# EasyEDA Pro project 物联网底板.eprj, schematic 物联网底板
Board Name: PCB4; Create Date: 2026-09-08; Page Name: P1; Project Name: 物联网底板; Schematic Name: 物联网底板; Update Date: 2026-09-11; Company: 嘉立创EDA; Page Size: A4; Version: V1.0
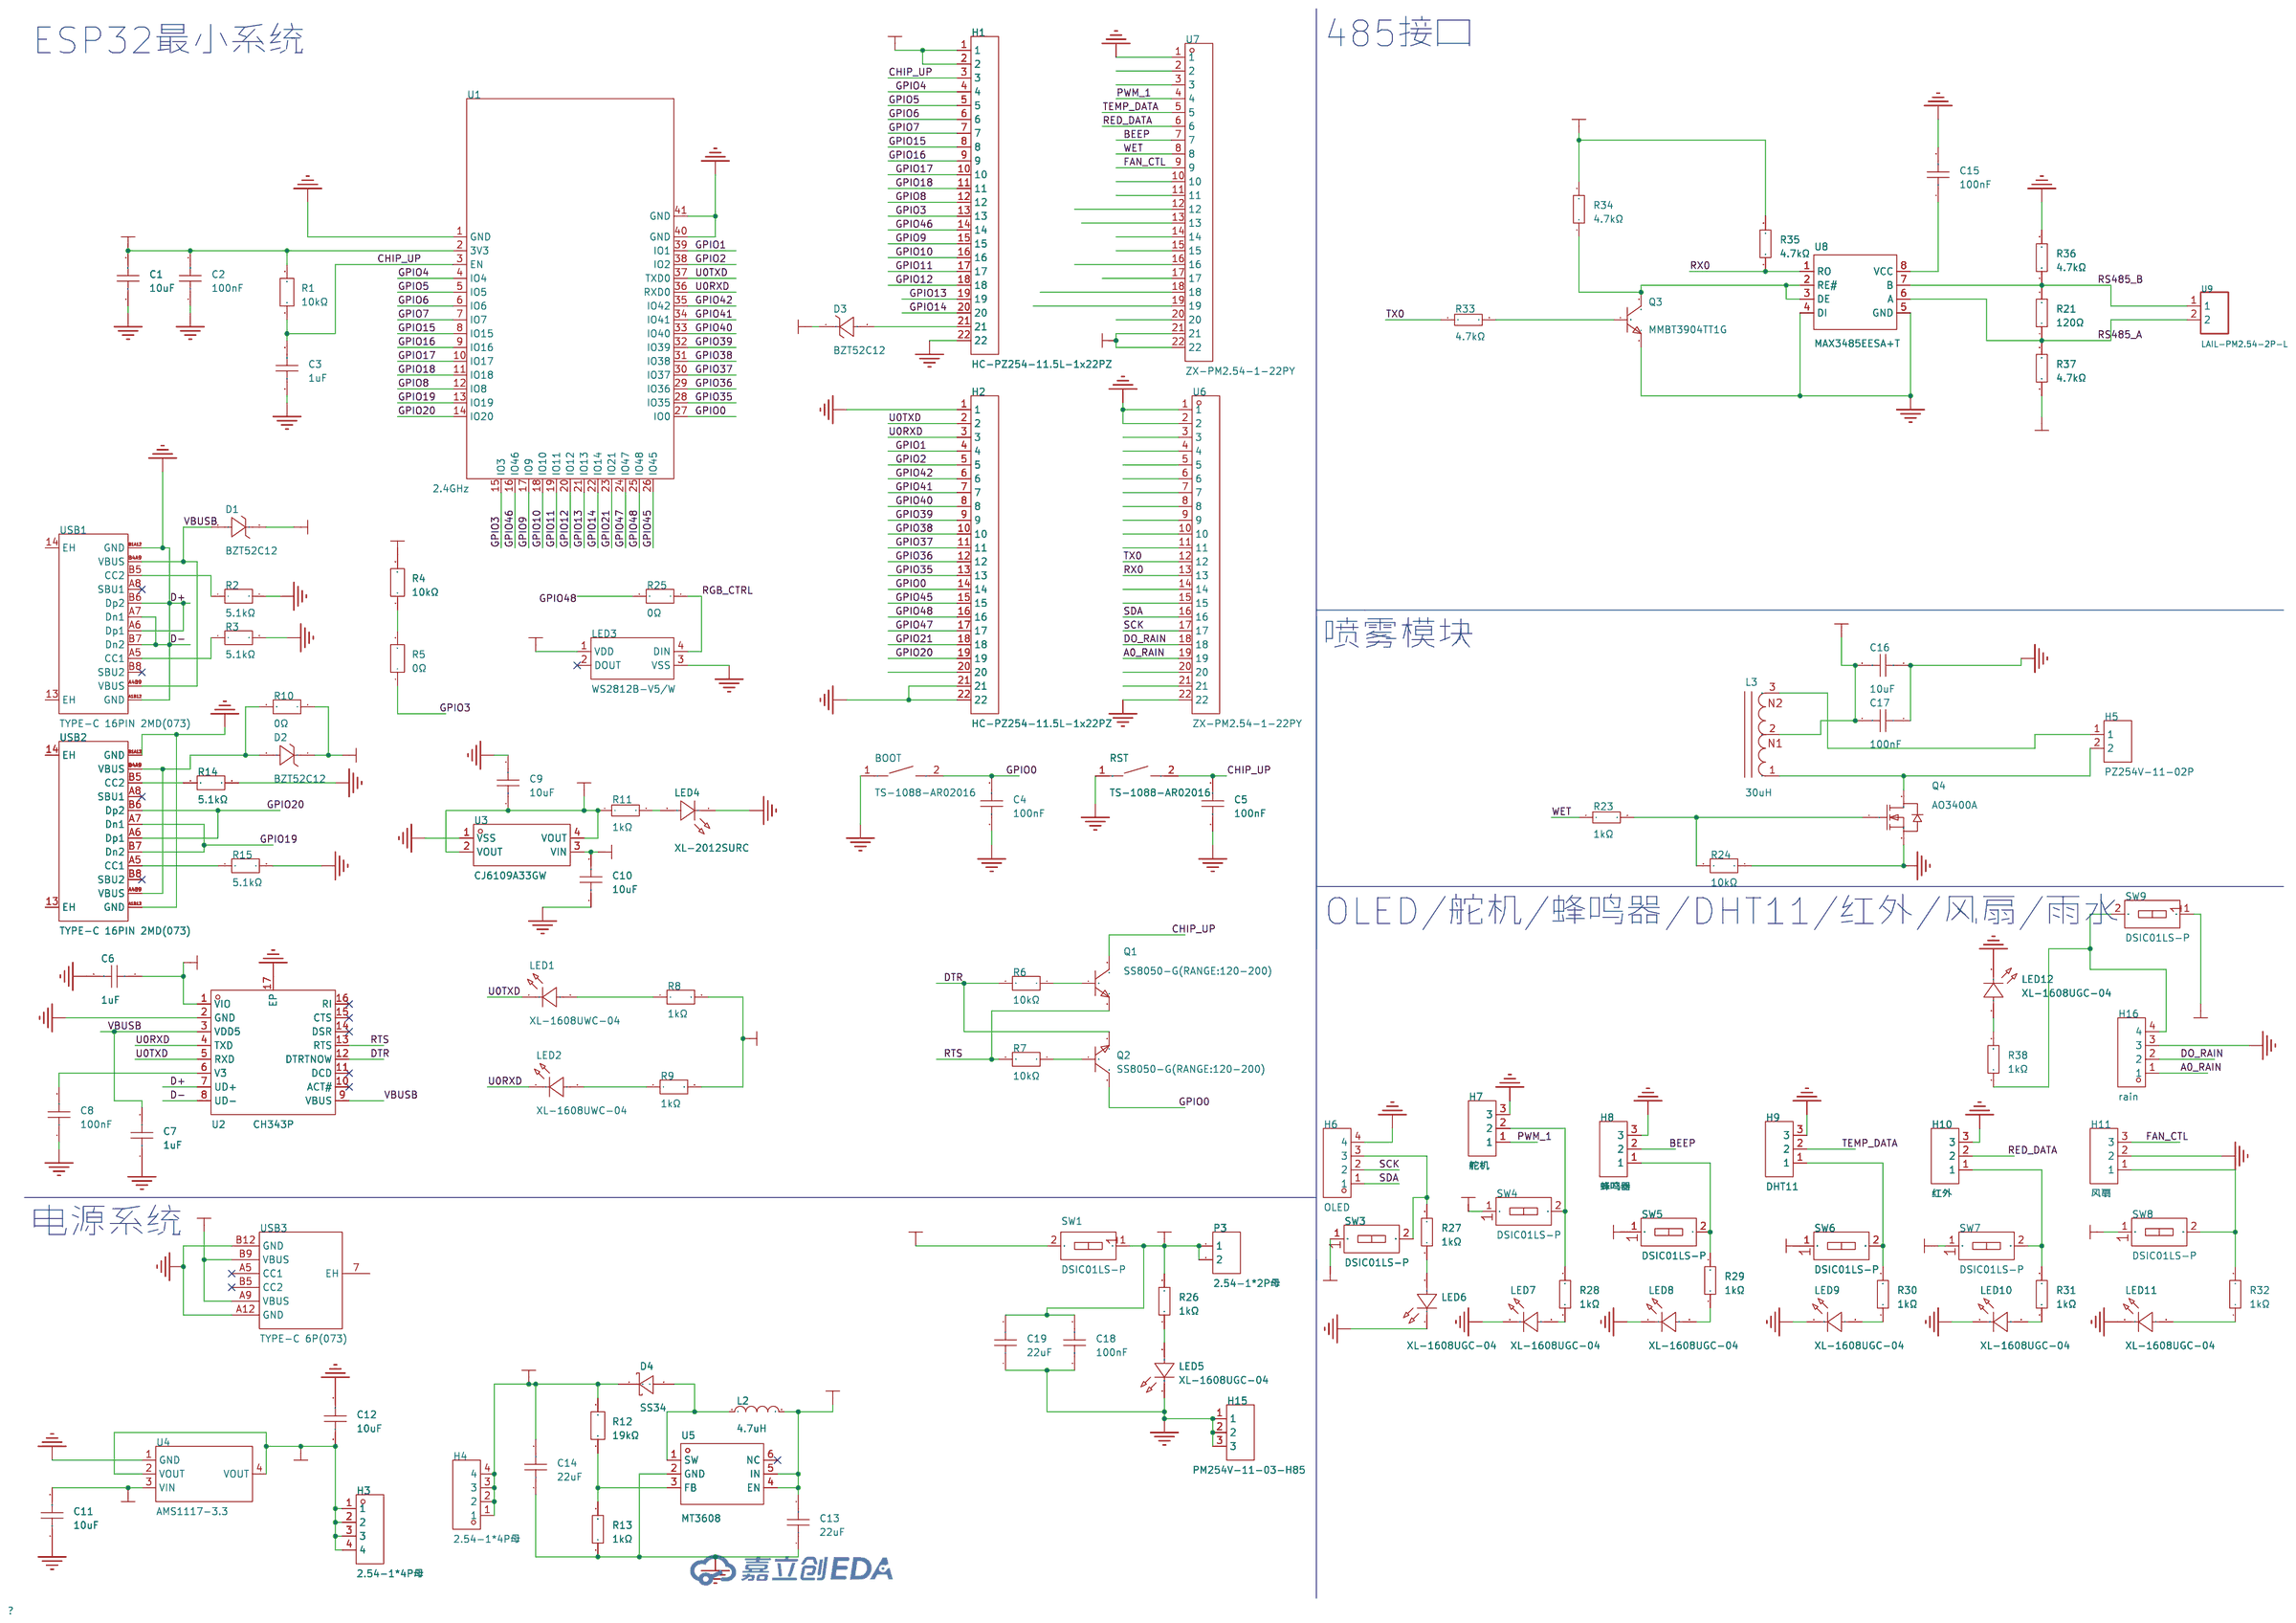
[diagram p1: schematic sheet]

## Parts
BOOT  TS-1088-AR02016  [SW-SMD_L3.9-W3.0-P4.45]
C1  10uF  [C0402]
C2  100nF  [C0402]
C3  1uF  [C0402]
C4  100nF  [C0402]
C5  100nF  [C0402]
C6  1uF  [C0402]
C7  1uF  [C0402]
C8  100nF  [C0402]
C9  10uF  [C0402]
C10  10uF  [C0402]
C11  10uF  [C0402]
C12  10uF  [C0402]
C13  22uF  [C0603]
C14  22uF  [C0603]
C15  100nF  [C0603]
C16  10uF  [C0402]
C17  100nF  [C0402]
C18  100nF  [C0603]
C19  22uF  [C0603]
D1  BZT52C12  [SOD-123_L2.7-W1.6-LS3.7-RD]
D2  BZT52C12  [SOD-123_L2.7-W1.6-LS3.7-RD]
D3  BZT52C12  [SOD-123_L2.7-W1.6-LS3.7-RD]
D4  SS34  [SMA_L4.3-W2.6-LS5.2-RD]
H1  HC-PZ254-11.5L-1x22PZ  [HDR-TH_22P-P2.54-V-M]
H2  HC-PZ254-11.5L-1x22PZ  [HDR-TH_22P-P2.54-V-M]
H3  2.54-1*4P母  [HDR-TH_4P-P2.54-V-F]
H4  2.54-1*4P母  [HDR-TH_4P-P2.54-V-F]
H5  PZ254V-11-02P  [HDR-TH_2P-P2.54-V-M]
H6  OLED  [HDR-TH_4P-P2.54-V-F]
H7  舵机  [HDR-TH_3P-P2.54-V-M_PZ254V-11-03P]
H8  蜂鸣器  [HDR-TH_3P-P2.54-V-F]
H9  DHT11  [HDR-TH_3P-P2.54-V-F]
H10  红外  [HDR-TH_3P-P2.54-V-F]
H11  风扇  [HDR-TH_3P-P2.54-V-F]
H15  PM254V-11-03-H85  [HDR-TH_3P-P2.54-V-F]
H16  rain  [HDR-TH_4P-P2.54-V-F]
L2  4.7uH  [IND-SMD_L2.5-W2.0-VLS252012CX-150M]
L3  30uH  [IND-TH_3P-BD9.5_XR8X10-300K-152K-L]
LED1  XL-1608UWC-04  [LED0603-RD_WHITE]
LED2  XL-1608UWC-04  [LED0603-RD_WHITE]
LED3  WS2812B-V5/W  [LED-SMD_4P-L5.0-W5.0-TL-1]
LED4  XL-2012SURC  [LED0805-RD_RED]
LED5  XL-1608UGC-04  [LED0603-RD_GREEN]
LED6  XL-1608UGC-04  [LED0603-RD_GREEN]
LED7  XL-1608UGC-04  [LED0603-RD_GREEN]
LED8  XL-1608UGC-04  [LED0603-RD_GREEN]
LED9  XL-1608UGC-04  [LED0603-RD_GREEN]
LED10  XL-1608UGC-04  [LED0603-RD_GREEN]
LED11  XL-1608UGC-04  [LED0603-RD_GREEN]
LED12  XL-1608UGC-04  [LED0603-RD_GREEN]
P3  2.54-1*2P母  [HDR-TH_2P-P2.54-V-F]
Q1  SS8050-G(RANGE:120-200)  [SOT-23-3_L2.9-W1.3-P1.90-LS2.4-BR]
Q2  SS8050-G(RANGE:120-200)  [SOT-23-3_L2.9-W1.3-P1.90-LS2.4-BR]
Q3  MMBT3904TT1G  [SC-75-3_L1.6-W0.8-P1.00-LS1.6-BR]
Q4  AO3400A  [SOT-23-3_L2.9-W1.3-P1.90-LS2.4-BR]
R1  10kΩ  [R0402]
R2  5.1kΩ  [R0402]
R3  5.1kΩ  [R0402]
R4  10kΩ  [R0402]
R5  0Ω  [R0603]
R6  10kΩ  [R0402]
R7  10kΩ  [R0402]
R8  1kΩ  [R0402]
R9  1kΩ  [R0402]
R10  0Ω  [R0603]
R11  1kΩ  [R0402]
R12  19kΩ  [R0805]
R13  1kΩ  [R0603]
R14  5.1kΩ  [R0402]
R15  5.1kΩ  [R0402]
R21  120Ω  [R0805]
R23  1kΩ  [R0603]
R24  10kΩ  [R0402]
R25  0Ω  [R0603]
R26  1kΩ  [R0603]
R27  1kΩ  [R0603]
R28  1kΩ  [R0603]
R29  1kΩ  [R0603]
R30  1kΩ  [R0603]
R31  1kΩ  [R0603]
R32  1kΩ  [R0603]
R33  4.7kΩ  [R0603]
R34  4.7kΩ  [R0603]
R35  4.7kΩ  [R0603]
R36  4.7kΩ  [R0603]
R37  4.7kΩ  [R0603]
R38  1kΩ  [R0603]
RST  TS-1088-AR02016  [SW-SMD_L3.9-W3.0-P4.45]
SW1  DSIC01LS-P  [SW-SMD_2P-L3.5-W6.1-P2.54-LS9.8]
SW3  DSIC01LS-P  [SW-SMD_2P-L3.5-W6.1-P2.54-LS9.8]
SW4  DSIC01LS-P  [SW-SMD_2P-L3.5-W6.1-P2.54-LS9.8]
SW5  DSIC01LS-P  [SW-SMD_2P-L3.5-W6.1-P2.54-LS9.8]
SW6  DSIC01LS-P  [SW-SMD_2P-L3.5-W6.1-P2.54-LS9.8]
SW7  DSIC01LS-P  [SW-SMD_2P-L3.5-W6.1-P2.54-LS9.8]
SW8  DSIC01LS-P  [SW-SMD_2P-L3.5-W6.1-P2.54-LS9.8]
SW9  DSIC01LS-P  [SW-SMD_2P-L3.5-W6.1-P2.54-LS9.8]
U1  2.4GHz  [WIRELM-SMD_ESP32-S3-WROOM-1]
U2  CH343P  [TQFN-16_L3.0-W3.0-P0.50-BL-EP1.7]
U3  CJ6109A33GW  [SOT-223-3_L6.5-W3.4-P2.30-LS7.0-BR]
U4  AMS1117-3.3  [SOT-223-3_L6.5-W3.4-P2.30-LS7.0-BR]
U5  MT3608  [SOT-23-6_L2.9-W1.6-P0.95-LS2.8-BL]
U6  ZX-PM2.54-1-22PY  [HDR-TH_22P-P2.54-V-F]
U7  ZX-PM2.54-1-22PY  [HDR-TH_22P-P2.54-V-F]
U8  MAX3485EESA+T  [SOIC-8_L4.9-W3.9-P1.27-LS6.0-BL]
U9  LAIL-PM2.54-2P-L  [HDR-TH_2P-P2.54-V-F]
USB1  TYPE-C 16PIN 2MD(073)  [USB-C-SMD_TYPE-C-16PIN-2MD-073]
USB2  TYPE-C 16PIN 2MD(073)  [USB-C-SMD_TYPE-C-16PIN-2MD-073]
USB3  TYPE-C 6P(073)  [TYPE-C-SMD_TYPE-C-6P-073]

## Library data of the parts
BOOT RST = TS-1088-AR02016: LCSC Part Name: 3.9*3*2mm 立贴 轻触开关; Supplier Part: C720477; Manufacturer: XUNPU(讯普); Supplier Footprint: SMD,4x3mm; JLCPCB Part Class: 基础库; Datasheet: https://item.szlcsc.com/datasheet/TS-1088-AR02016/763484.html; Supplier: LCSC; Circuit: 单刀单掷; Actuator Style: 圆形按钮; Operating Force: 1.6N; Mounting Type: 立贴; Length: 3.9mm; Width: 3mm; Switch Height: 2mm; with Bracket: 不带支架; Contact Current: 50mA; Voltage Rating: 12V; Actuator/Cap Color: 黑色; Termination Style: SMD接片; Life: 10万次; Operating Temperature: -30℃~+80℃
C1 C9-C12 C16 = HGC0402R5106M100NTEJ: LCSC Part Name: 10uF ±20% 10V; Supplier Part: C7472949; Manufacturer: Chinocera(华瓷); Supplier Footprint: 0402; JLCPCB Part Class: 扩展库; Datasheet: https://item.szlcsc.com/datasheet/HGC0402R5106M100NTEJ/8532796.html; Supplier: LCSC; Tolerance: ±20%; Voltage Rating: 10V; Temperature Coefficient: X5R
C2 C4 C5 C8 C17 = CL05B104KO5NNNC: LCSC Part Name: 100nF ±10% 16V; Supplier Part: C1525; Manufacturer: SAMSUNG(三星); Supplier Footprint: 0402; JLCPCB Part Class: 基础库; Datasheet: https://item.szlcsc.com/datasheet/CL05B104KO5NNNC/1877.html; Supplier: LCSC; Tolerance: ±10%; Voltage Rating: 16V; Temperature Coefficient: X7R
C3 C6 C7 = HGC0402R5105K500NTEJ: LCSC Part Name: 1uF ±10% 50V; Supplier Part: C7472948; Manufacturer: Chinocera(华瓷); Supplier Footprint: 0402; JLCPCB Part Class: 扩展库; Datasheet: https://item.szlcsc.com/datasheet/HGC0402R5105K500NTEJ/8532795.html; Supplier: LCSC; Tolerance: ±10%; Voltage Rating: 50V; Temperature Coefficient: X5R
C13 C14 C19 = CL10A226MQ8NRNC: LCSC Part Name: 22uF ±20% 6.3V; Supplier Part: C59461; Manufacturer: SAMSUNG(三星); Supplier Footprint: 0603; JLCPCB Part Class: 基础库; Datasheet: https://item.szlcsc.com/datasheet/CL10A226MQ8NRNC/60514.html; Supplier: LCSC; Tolerance: ±20%; Voltage Rating: 6.3V; Temperature Coefficient: X5R
C15 C18 = CC0603KRX7R9BB104: LCSC Part Name: 100nF ±10% 50V; Supplier Part: C14663; Manufacturer: YAGEO(国巨); Supplier Footprint: 0603; JLCPCB Part Class: 基础库; Datasheet: https://item.szlcsc.com/datasheet/CC0603KRX7R9BB104/15331.html; Supplier: LCSC; Tolerance: ±10%; Voltage Rating: 50V; Temperature Coefficient: X7R
D1-D3 = BZT52C12_C19077410: LCSC Part Name: 表面贴装齐纳二极管; Supplier Part: C19077410; Manufacturer: R+O(宏嘉诚); Supplier Footprint: SOD-123; JLCPCB Part Class: 扩展库; Datasheet: https://item.szlcsc.com/datasheet/BZT52C12/20275495.html; Supplier: LCSC; Diode Configuration: 1个独立式; Zener Voltage(Nom): 12V; Reverse Leakage Current (Ir): 100nA@8V; Zener Voltage(Range): 11.4V~12.6V; Pd - Power Dissipation: 350mW; Impedance(Zzt): 25Ω; Impedance(Zzk): 150Ω; Operating Junction Temperature Range: -55℃~+150℃
D4 = SS34_C8678: LCSC Part Name: 电压:40V 电流:3A; Supplier Part: C8678; Manufacturer: MDD(辰达半导体); Supplier Footprint: SMA(DO-214AC); JLCPCB Part Class: 基础库; Datasheet: https://item.szlcsc.com/datasheet/SS34/9178.html; Supplier: LCSC; Diode Configuration: 独立式; Voltage - Forward(Vf@If): 550mV@3A; Voltage - DC Reverse(Vr): 40V; Current - Rectified: 3A; Reverse Leakage Current (Ir): 500uA@40V; Operating Junction Temperature Range: -55℃~+125℃
H1 H2 = HC-PZ254-11.5L-1x22PZ: LCSC Part Name: 1x22P 间距:2.54mm 方针 直插; Supplier Part: C41375941; Manufacturer: HC(虹成电子); Supplier Footprint: 插件,P=2.54mm; JLCPCB Part Class: 扩展库; Datasheet: https://item.szlcsc.com/datasheet/HC-PZ254-11.5L-1x22PZ/43143790.html; Supplier: LCSC; Pin Structure: 1x22P; Pitch: 2.54mm; Circluar Pins/Square Pins: 方针; Mounting Type: 直插; Number of Rows: 单排; Number of Pins: 22P; Current Rating: 3A; Length of Mating Pin: 6mm; Insulation Height: 2.5mm; Length of End Connection Pin: 3mm; Contact Material: 黄铜; Contact Plating: 金; Operating Temperature: -40℃~+105℃; Color: 黑色
H3 H4 H6 H16 = 2.54-1*4P母: LCSC Part Name: 间距:2.54mm 1x4P 直插; Supplier Part: C2718488; Manufacturer: BOOMELE(博穆精密); Supplier Footprint: 插件,P=2.54mm; JLCPCB Part Class: 扩展库; Datasheet: https://item.szlcsc.com/datasheet/2.54-1*4P%25E6%25AF%258D/2834502.html; Supplier: LCSC; Holes Structure: 1x4P; Pitch: 2.54mm; Circular Hole / Square Hole: 方孔; Mounting Type: 直插; Number of Rows: 单排; Number of Positions: 4P; Current Rating: 3A; Holes Direction: 顶部; Contact Material: 青铜; Operating Temperature: -40℃~+105℃
H5 = PZ254V-11-02P: LCSC Part Name: 1x2P 间距:2.54mm 方针 直插; Supplier Part: C492401; Manufacturer: XFCN(兴飞); Supplier Footprint: 插件,P=2.54mm; JLCPCB Part Class: 扩展库; Datasheet: https://item.szlcsc.com/datasheet/PZ254V-11-02P/502957.html; Supplier: LCSC; Pin Structure: 1x2P; Pitch: 2.54mm; Circluar Pins/Square Pins: 方针; Mounting Type: 直插; Number of Rows: 单排; Number of Pins: 2P; Current Rating: 3A; Voltage Rating (Max): 250V; Length of Mating Pin: 6.1mm; Insulation Height: 2.5mm; Length of End Connection Pin: 3mm; Contact Material: 黄铜; Contact Plating: 金; Operating Temperature: -40℃~+105℃; Color: 黑色
H7 = PZ254V-11-03P: LCSC Part Name: 1x3P 间距:2.54mm 方针 直插; Supplier Part: C2937625; Manufacturer: XFCN(兴飞); Supplier Footprint: 插件,P=2.54mm; JLCPCB Part Class: Extended Part; Datasheet: https://item.szlcsc.com/datasheet/PZ254V-11-03P/3293280.html; Supplier: LCSC; Pin Structure: 1x3P; Pitch: 2.54mm; Circluar Pins/Square Pins: 方针; Mounting Type: 直插; Number of Rows: 单排; Number of Pins: 3P; Current Rating: 3A; Voltage Rating (Max): 250V; Length of Mating Pin: 6.1mm; Insulation Height: 2.5mm; Length of End Connection Pin: 3mm; Contact Material: 黄铜; Contact Plating: 金; Operating Temperature: -40℃~+105℃; Color: 黑色
H8-H11 H15 = PM254V-11-03-H85: LCSC Part Name: 1x3P 间距:2.54mm 直插; Supplier Part: C541850; Manufacturer: XFCN(兴飞); Supplier Footprint: 插件,P=2.54mm; JLCPCB Part Class: 扩展库; Datasheet: https://item.szlcsc.com/datasheet/PM254V-11-03-H85/562471.html; Supplier: LCSC; Holes Structure: 1x3P; Pitch: 2.54mm; Circular Hole / Square Hole: 方孔; Mounting Type: 直插; Number of Rows: 单排; Number of Positions: 3P; Current Rating: 3A; Holes Direction: 顶部; Insulation Height: 8.5mm; Contact Material: 黄铜; Operating Temperature: -40℃~+105℃
L2 = FTC252010S4R7MBCA: LCSC Part Name: 4.7uH ±20% 2.6A; Supplier Part: C5832360; Manufacturer: cjiang(长江微电); Supplier Footprint: 1008; JLCPCB Part Class: 扩展库; Datasheet: https://item.szlcsc.com/datasheet/FTC252010S4R7MBCA/6763480.html; Supplier: LCSC; Tolerance: ±20%; Current Rating: 2A; Current - Saturation(Isat): 2.6A; DC Resistance(DCR): 160mΩ
L3 = XR8*10-300K-152K-L: LCSC Part Name: XR8*10 30uH:1.5mH 0.19线 三脚电感; Supplier Part: C48947010; Manufacturer: XR(祥如); Supplier Footprint: 插件,D9.5xL14mm; JLCPCB Part Class: 扩展库; Datasheet: https://item.szlcsc.com/datasheet/XR8*10-300K-152K-L/51267337.html; Supplier: LCSC; Tolerance: ±15%; DC Resistance(DCR): 5Ω; Type: 工字电感; Wire Diameter: 0.19mm
LED1 LED2 = XL-1608UWC-04: LCSC Part Name: 0603白光贴片式发光二极管; Supplier Part: C965808; Manufacturer: XINGLIGHT(成兴光); Supplier Footprint: 0603; JLCPCB Part Class: 扩展库; Datasheet: https://item.szlcsc.com/datasheet/XL-1608UWC-04/1051417.html; Supplier: LCSC; Lamp Holder Type: 1.6mmx0.8mm方形灯头; Illumination Color: 白色; Voltage - Forward(Vf): 2.7V; Power(Watts): 70mW; Test Current: 20mA; Diode Configuration: 独立二极管; Lens Color: 黄色透镜; Color Temperature: 10000K~33000K; Luminous Intensity: 630mcd; Viewing Angle: 120°; Mounting Style: 正贴; Operating Temperature: -40℃~+85℃; ESD Withstand Voltage: 2000V
LED3 = WS2812B-V5/W: LCSC Part Name: RGB三色; Supplier Part: C2874885; Manufacturer: worldsemi; Supplier Footprint: SMD5050-4P; JLCPCB Part Class: 扩展库; Datasheet: https://item.szlcsc.com/datasheet/WS2812B-V5%252FW/3081328.html; Supplier: LCSC; Dominant Wavelength - R: 620nm~630nm; Dominant Wavelength - G: 515nm~525nm; Dominant Wavelength - B: 465nm~475nm; Data Transmission Rate: 800Kbit/s; Voltage - Supply: 5V; Quiescent Current: 0.6mA; Lens Color: 白色雾状透镜; Operating Temperature: -40℃~+65℃; Fixed-Frequency Pwm Mode: 2kHz; Length: 5mm; Width: 1.57mm; Height: 5.4mm; Features: 内置上电复位电路；集成智能反向连接保护功能；内置掉电复位电路; Luminous Intensity - R: 310mcd; Luminous Intensity - G: 780mcd; Luminous Intensity - B: 215mcd; Transmission Delay: 300ns; Fall Time: 120us
LED4 = XL-2012SURC: LCSC Part Name: 0805红贴片式发光二极管; Supplier Part: C965812; Manufacturer: XINGLIGHT(成兴光); Supplier Footprint: 0805; JLCPCB Part Class: Extended Part; Datasheet: https://item.szlcsc.com/datasheet/XL-2012SURC/1051421.html; Supplier: LCSC; Lamp Holder Type: 2mmx1.2mm方形灯头; Illumination Color: 红色; Voltage - Forward(Vf): 2.3V; Power(Watts): 50mW; Forward Current: 20mA; Wavelength - Dominant: 615nm~630nm; Peak Wavelength: 620nm; Diode Configuration: 独立二极管; Lens Color: 无色透明透镜; Luminous Intensity: 230mcd; Viewing Angle: 120°; Mounting Style: 正贴; Operating Temperature: -40℃~+85℃
LED5-LED12 = XL-1608UGC-04: LCSC Part Name: 0603翠绿贴片式发光二极管; Supplier Part: C965804; Manufacturer: XINGLIGHT(成兴光); Supplier Footprint: 0603; JLCPCB Part Class: 扩展库; Datasheet: https://item.szlcsc.com/datasheet/XL-1608UGC-04/1051413.html; Supplier: LCSC; Lamp Holder Type: 1.6mmx0.8mm方形灯头; Illumination Color: 翠绿色; Voltage - Forward(Vf): 3.3V; Power(Watts): 70mW; Forward Current: 20mA; Wavelength - Dominant: 515nm~535nm; Peak Wavelength: 525nm; Diode Configuration: 独立二极管; Lens Color: 无色透明透镜; Luminous Intensity: 810mcd; Viewing Angle: 120°; Mounting Style: 正贴; Operating Temperature: -40℃~+85℃
P3 = 2.54-1*2P母: LCSC Part Name: 1x2P 间距:2.54mm 直插; Supplier Part: C49661; Manufacturer: BOOMELE(博穆精密); Supplier Footprint: 插件,P=2.54mm; JLCPCB Part Class: 扩展库; Datasheet: https://item.szlcsc.com/datasheet/2.54-1*2P%25E6%25AF%258D/50669.html; Supplier: LCSC; Holes Structure: 1x2P; Pitch: 2.54mm; Circular Hole / Square Hole: 方孔; Mounting Type: 直插; Number of Rows: 单排; Number of Positions: 2P; Current Rating: 3A; Holes Direction: 顶部; Contact Material: 黄铜; Operating Temperature: -40℃~+105℃; PIN Length: 3.3mm
Q1 Q2 = SS8050-G(RANGE:120-200): LCSC Part Name: L档(120-200) NPN 电流:1.5A 电压:25V; Supplier Part: C164886; Manufacturer: CJ(江苏长电/长晶); Supplier Footprint: SOT-23; JLCPCB Part Class: 扩展库; Datasheet: https://item.szlcsc.com/datasheet/SS8050-G(RANGE%253A120-200)/176268.html; Supplier: LCSC; type: NPN; Current - Collector(Ic): 1.5A; Collector - Emitter Voltage VCEO: 25V; Pd - Power Dissipation: 300mW; DC Current Gain: 120; Transition frequency(fT): 100MHz; Current - Collector Cutoff: 100nA; Vce Saturation(VCE(sat)): 500mV; Operating Temperature: -55℃~+150℃; Emitter-Base Voltage(Vebo): 5V; Number: 1个NPN
Q3 = MMBT3904TT1G: LCSC Part Name: NPN 电流:200mA 电压:40V; Supplier Part: C242260; Manufacturer: onsemi(安森美); Supplier Footprint: SOT-416; JLCPCB Part Class: Extended Part; Datasheet: https://item.szlcsc.com/datasheet/MMBT3904TT1G/241201.html; Supplier: LCSC; type: NPN; Current - Collector(Ic): 200mA; Collector - Emitter Voltage VCEO: 40V; Pd - Power Dissipation: 200mW; DC Current Gain: 100@0.1mA,1.0V; Transition frequency(fT): 300MHz; Current - Collector Cutoff: 50nA; Vce Saturation(VCE(sat)): 300mV@10mA,5mA; Operating Temperature: -65℃~+150℃; Emitter-Base Voltage(Vebo): 6V; Number: 1个NPN
Q4 = AO3400A_C20917: LCSC Part Name: N沟道 耐压:30V; Supplier Part: C20917; Manufacturer: AOS; Supplier Footprint: SOT-23; JLCPCB Part Class: 基础库; Datasheet: https://item.szlcsc.com/datasheet/AO3400A/21629.html; Supplier: LCSC; Number: 1个N沟道; Drain to Source Voltage: 30V; Current - Continuous Drain(Id): 5.7A; RDS(on): 48mΩ@2.5V; Pd - Power Dissipation: 1.4W; Gate Threshold Voltage (Vgs(th)): 1.45V; Gate Charge(Qg): 7nC@10V; Input Capacitance(Ciss): 630pF; Reverse Transfer Capacitance (Crss@Vds): 50pF; Operating Temperature: -55℃~+150℃; Type: N沟道; Output Capacitance(Coss): 75pF; Vgs: ±12V
R1 R4 R6 R7 R24 = FRC0402F1002TS: LCSC Part Name: 10kΩ ±1% 62.5mW 厚膜电阻; Supplier Part: C2906861; Manufacturer: FOJAN(富捷); Supplier Footprint: 0402; JLCPCB Part Class: Extended Part; Datasheet: https://item.szlcsc.com/datasheet/FRC0402F1002TS/3180374.html; Supplier: LCSC; Type: 厚膜电阻; Tolerance: ±1%; Power(Watts): 62.5mW; Voltage-Supply(Max): 50V; Temperature Coefficient: ±100ppm/℃; Operating Temperature: -55℃~+155℃
R2 R3 R14 R15 = FRC0402J512 TS: LCSC Part Name: 5.1kΩ ±5% 62.5mW 厚膜电阻; Supplier Part: C2906948; Manufacturer: FOJAN(富捷); Supplier Footprint: 0402; JLCPCB Part Class: 扩展库; Datasheet: https://item.szlcsc.com/datasheet/FRC0402J512%2520TS/3180461.html; Supplier: LCSC; Type: 厚膜电阻; Tolerance: ±5%; Power(Watts): 62.5mW; Voltage-Supply(Max): 50V; Temperature Coefficient: ±100ppm/℃; Operating Temperature: -55℃~+155℃
R5 R10 R25 = FRC0603F0000TS: LCSC Part Name: 0Ω ±1% 100mW 厚膜电阻; Supplier Part: C2906974; Manufacturer: FOJAN(富捷); Supplier Footprint: 0603; JLCPCB Part Class: 扩展库; Supplier: LCSC; Type: 厚膜电阻; Tolerance: ±1%; Power(Watts): 100mW; Voltage-Supply(Max): 75V; Operating Temperature: -55℃~+155℃
R8 R9 = FRC0402J102 TS: LCSC Part Name: 1kΩ ±5% 62.5mW 厚膜电阻; Supplier Part: C2906899; Manufacturer: FOJAN(富捷); Supplier Footprint: 0402; JLCPCB Part Class: 扩展库; Datasheet: https://item.szlcsc.com/datasheet/FRC0402J102%2520TS/3180412.html; Supplier: LCSC; Type: 厚膜电阻; Tolerance: ±5%; Power(Watts): 62.5mW; Voltage-Supply(Max): 50V; Temperature Coefficient: ±100ppm/℃; Operating Temperature: -55℃~+155℃
R11 = 0402WGF1001TCE: LCSC Part Name: 厚膜电阻 1kΩ ±1%; Supplier Part: C11702; Manufacturer: UNI-ROYAL(厚声); Supplier Footprint: 0402; JLCPCB Part Class: 基础库; Datasheet: https://item.szlcsc.com/datasheet/0402WGF1001TCE/12256.html; Supplier: LCSC; Type: 厚膜电阻; Tolerance: ±1%; Power(Watts): 62.5mW; Voltage-Supply(Max): 50V; Temperature Coefficient: ±100ppm/℃; Operating Temperature: -55℃~+155℃
R12 = FRC0805F1902TS: LCSC Part Name: 19kΩ ±1% 125mW 厚膜电阻; Supplier Part: C2930177; Manufacturer: FOJAN(富捷); Supplier Footprint: 0805; JLCPCB Part Class: 扩展库; Supplier: LCSC; Type: 厚膜电阻; Tolerance: ±1%; Power(Watts): 125mW; Voltage-Supply(Max): 150V; Temperature Coefficient: ±100ppm/℃; Operating Temperature: -55℃~+155℃
R13 R23 R26-R32 R38 = 0603WAF1001T5E: LCSC Part Name: 1kΩ ±1% 100mW 厚膜电阻; Supplier Part: C21190; Manufacturer: UNI-ROYAL(厚声); Supplier Footprint: 0603; JLCPCB Part Class: 基础库; Datasheet: https://item.szlcsc.com/datasheet/0603WAF1001T5E/21904.html; Supplier: LCSC; Type: 厚膜电阻; Tolerance: ±1%; Power(Watts): 100mW; Voltage-Supply(Max): 75V; Temperature Coefficient: ±100ppm/℃; Operating Temperature: -55℃~+155℃
R21 = 0805W8F1200T5E: LCSC Part Name: 厚膜电阻 120Ω ±1%; Supplier Part: C17437; Manufacturer: UNI-ROYAL(厚声); Supplier Footprint: 0805; JLCPCB Part Class: 基础库; Datasheet: https://item.szlcsc.com/datasheet/0805W8F1200T5E/18125.html; Supplier: LCSC; Type: 厚膜电阻; Tolerance: ±1%; Power(Watts): 125mW; Voltage-Supply(Max): 150V; Temperature Coefficient: ±100ppm/℃; Operating Temperature: -55℃~+155℃
R33-R37 = 0603WAF4701T5E: LCSC Part Name: 厚膜电阻 4.7kΩ ±1%; Supplier Part: C23162; Manufacturer: UNI-ROYAL(厚声); Supplier Footprint: 0603; JLCPCB Part Class: 基础库; Datasheet: https://item.szlcsc.com/datasheet/0603WAF4701T5E/23889.html; Supplier: LCSC; Type: 厚膜电阻; Tolerance: ±1%; Power(Watts): 100mW; Voltage-Supply(Max): 75V; Temperature Coefficient: ±100ppm/℃; Operating Temperature: -55℃~+155℃
SW1 SW3-SW9 = DSIC01LS-P: LCSC Part Name: 平拨,凸起式 1位拨码开关; Supplier Part: C600988; Manufacturer: XKB Connection(中国星坤); Supplier Footprint: SMD; JLCPCB Part Class: 扩展库; Datasheet: https://item.szlcsc.com/datasheet/DSIC01LS-P/631008.html; Supplier: LCSC; Type: 平拨,凸起式; Circuit: 单刀单掷; Number of Positions: 1位; Termination Style: 鸥翼型; Current Rating: 25mA; Voltage Rating: 24V; Operating Temperature: -20℃~+70℃; Operating Life: 3千次; Color: 黑色
U1 = ESP32-S3-WROOM-1-N16R8: LCSC Part Name: 不带固件 通用型Wi-Fi+低功耗蓝牙MCU模组; Supplier Part: C2913202; Manufacturer: ESPRESSIF(乐鑫); Supplier Footprint: SMD,25.5x18mm; JLCPCB Part Class: 扩展库; Datasheet: https://item.szlcsc.com/datasheet/ESP32-S3-WROOM-1-N16R8/3198300.html; Supplier: LCSC; Utilized IC / Part: ESP32-S3R8; Interface Type: I2C；GPIO；UART；SPI；USB；I2S; Antenna Type: 板载PCB天线; Output Power: 20.5dBm; Voltage - Supply: 3V~3.6V; Receive  Current: 95mA; Send  Current: 355mA; Sensitivity: -103.5dBm; Operating Temperature: -40℃~+65℃
U2 = CH343P: LCSC Part Name: USB转高速串口芯片; Supplier Part: C2846043; Manufacturer: WCH(南京沁恒); Supplier Footprint: TQFN-16-EP(3x3); JLCPCB Part Class: 扩展库; Datasheet: https://item.szlcsc.com/datasheet/CH343P/3039795.html; Supplier: LCSC; Applications Function: USB转UART; USB Protocol: USB 2.0; Voltage - Supply: 3.3V；5V; Data Rate: 6Mbps; Operating Temperature: -40℃~+85℃; Current - Supply: 3mA; Quiescent Supply Current: 90uA; Features: 可编程波特率；唤醒功能；内置时钟发生器；硬件流控支持；低功耗模式；上电复位
U3 = CJ6109A33GW: LCSC Part Name: 3.3V 1A 6V; Supplier Part: C17703064; Manufacturer: CJ(江苏长电/长晶); Supplier Footprint: SOT-223; JLCPCB Part Class: 扩展库; Datasheet: https://item.szlcsc.com/datasheet/CJ6109A33GW/18842775.html; Supplier: LCSC; Output Configuration: 正极; Voltage - Supply: 6V; Output Voltage: 3.3V; Output Current: 1A; Power Supply Rejection Ratio (PSRR): 70dB@(10kHz); Voltage Dropout: 320mV@(1A); standby current: 70uA; Features: 使能控制；短路保护；过流保护；热关断; Operating Temperature: -40℃~+125℃@(Tj); Output Type: 固定; Number of Outputs: 1
U4 = AMS1117-3.3_C6186: LCSC Part Name: 3.3V 1A 15V; Supplier Part: C6186; Manufacturer: AMS; Supplier Footprint: SOT-223; JLCPCB Part Class: 基础库; Datasheet: https://item.szlcsc.com/datasheet/AMS1117-3.3/6652.html; Supplier: LCSC; Output Type: 固定; Voltage - Supply: 15V; Output Voltage: 3.3V; Output Current: 1A; Power Supply Rejection Ratio (PSRR): 72dB@(120Hz); Voltage Dropout: 1.1V@(800mA); standby current: 5mA; Noise: 0.003%Vout; Features: 过流保护；热关断; Operating Temperature: -40℃~+125℃; Output Configuration: 正极; Number of Outputs: 1
U5 = MT3608: LCSC Part Name: 老版本 高效1.2MHz 2A升压转换器; Supplier Part: C84817; Manufacturer: 西安航天民芯; Supplier Footprint: SOT-23-6; JLCPCB Part Class: 扩展库; Datasheet: https://item.szlcsc.com/datasheet/MT3608/85988.html; Supplier: LCSC; Function: 升压型; Output Type: 可调; Voltage - Supply: 2V~24V; Output Current: 2A; Frequency - Switching: 1.2MHz; Operating Temperature: -40℃~+85℃; Synchronous Rectifier: 否; Number of Outputs: 1; Topology: 升压式; Quiescent Current: 100uA；1.6mA; Switch tube (built-in/external): 内置
U6 U7 = ZX-PM2.54-1-22PY: LCSC Part Name: 1x22P 间距:2.54mm 直插; Supplier Part: C7499337; Manufacturer: Megastar(兆星); Supplier Footprint: 插件,P=2.54mm; JLCPCB Part Class: 扩展库; Datasheet: https://item.szlcsc.com/datasheet/ZX-PM2.54-1-22PY/8573998.html; Supplier: LCSC; Holes Structure: 1x22P; Pitch: 2.54mm; Circular Hole / Square Hole: 方孔; Mounting Type: 直插; Number of Rows: 单排; Number of Positions: 22P; Current Rating: 3A; Holes Direction: 顶部; Insulation Height: 8.5mm; Contact Material: 黄铜; Contact Plating: 金; Operating Temperature: -40℃~+105℃; PIN Length: 3.2mm
U8 = MAX3485EESA+T: LCSC Part Name: 3.3V供电，±15kV ESD保护，12Mbps和斜率限制的真正RS-485/RS-422收发器; Supplier Part: C9943; Manufacturer: ADI(亚德诺)/MAXIM(美信); Supplier Footprint: SOIC-8; JLCPCB Part Class: 扩展库; Datasheet: https://item.szlcsc.com/datasheet/MAX3485EESA%252BT/10478.html; Supplier: LCSC; Type: 收发器; Number of Drivers: 1; Number of Receivers: 1; Voltage - Supply: 3V~3.6V; Data Rate: 12Mbps; ESD Protect: ±15kV; Operating Temperature: -40℃~+85℃; Quiescent Supply Current: 2.2mA; Communication Mode: 半双工
U9 = LAIL-PM2.54-2P-L: LCSC Part Name: 1x2P 间距:2.54mm 直插; Supplier Part: C54973825; Manufacturer: LAILAN(莱联); Supplier Footprint: 插件,P=2.54mm; JLCPCB Part Class: 扩展库; Datasheet: https://item.szlcsc.com/datasheet/LAIL-PM2.54-2P-L/58554903.html; Supplier: LCSC; Holes Structure: 1x2P; Pitch: 2.54mm; Circular Hole / Square Hole: 方孔; Mounting Type: 直插; Number of Rows: 单排; Number of Positions: 2P; Current Rating: 3A; Voltage Rating (Max): 250V; Holes Direction: 顶部; Insulation Height: 8.5mm; Contact Material: 黄铜; Contact Plating: 金; Operating Temperature: -25℃~+80℃; PIN Length: 3mm
USB1 USB2 = TYPE-C 16PIN 2MD(073): LCSC Part Name: Type-C 母 卧贴; Supplier Part: C2765186; Manufacturer: SHOU HAN(首韩); Supplier Footprint: SMD; JLCPCB Part Class: 扩展库; Datasheet: https://item.szlcsc.com/datasheet/TYPE-C%252016PIN%25202MD(073)/2901843.html; Supplier: LCSC; Connector Type: Type-C; Gender: 母; Mounting Type: 卧贴; Number of Contacts: 16P; Number of Ports: 1; Current Rating-Power: 3A; Voltage Rating: 5V; Connect-Disconnect Life: 1万次; Detection color: 黑色; Operating Temperature: -25℃~+85℃
USB3 = TYPE-C 6P(073): LCSC Part Name: 6P卧贴母座; Supplier Part: C668623; Manufacturer: SHOU HAN(首韩); Supplier Footprint: SMD; JLCPCB Part Class: 扩展库; Datasheet: https://item.szlcsc.com/datasheet/TYPE-C%25206P(073)/698566.html; Supplier: LCSC; Connector Type: Type-C; Gender: 母; Mounting Type: 卧贴; Number of Contacts: 6P; Number of Ports: 1; Current Rating-Power: 3A; Voltage Rating: 5V; Connect-Disconnect Life: 1万次; Detection color: 黑色; Operating Temperature: -25℃~+85℃

## Nets
3.3V: C1.2 C2.2 C6.1 C9.1 C12.1 H1.1 H1.2 H3.1 H3.2 H3.3 H3.4 R1.2 R4.2 R11.1 R34.2 R35.2 R37.1 SW3.1(PIN1) SW5.1(PIN1) U1.2(3V3) U2.1(VIO) U3.2(VOUT) U3.4(VOUT) U4.2(VOUT) U4.4(VOUT) U7.21 U7.22
12V: C14.2 D4.1(K) H4.1 H4.2 H4.3 H4.4 R12.2
+5V: C10.2 C11.2 C13.2 C16.2 C17.2 C18.2 C19.2 D1.1(K) D2.1(K) D3.1(K) L2.2 L3.2 LED3.1(VDD) P3.1 P3.2 R10.1 R26.2 SW1.1(PIN1) SW4.1(PIN1) SW6.1(PIN1) SW7.1(PIN1) SW8.1(PIN1) SW9.1(PIN1) U3.3(VIN) U4.3(VIN) U5.4(EN) U5.5(IN)
GND: BOOT.1 C1.1 C2.1 C3.1 C4.1 C5.1 C6.2 C7.1 C8.1 C9.2 C10.1 C11.1 C12.2 C13.1 C14.1 C15.2 C16.1 C17.1 C18.1 C19.1 H1.22 H2.1 H2.21 H2.22 H6.4 H7.3 H8.3 H9.3 H10.3 H11.2 H15.1 H15.2 H15.3 H16.3 LED3.3(VSS) LED4.1(K) LED5.1(K) LED6.1(K) LED7.1(K) LED8.1(K) LED9.1(K) LED10.1(K) LED11.1(K) LED12.1(K) Q3.2(E) Q4.2(S) R2.2 R3.2 R13.1 R14.2 R15.2 R24.1 R36.2 RST.1 U1.1(GND) U1.40(GND) U1.41(GND) U2.2(GND) U2.17(EP) U3.1(VSS) U4.1(GND) U5.2(GND) U6.1 U6.2 U6.22 U7.1 U8.4(DI) U8.5(GND) USB1.A1B12(GND) USB1.B1A12(GND) USB2.A1B12(GND) USB2.B1A12(GND) USB3.A12(GND) USB3.B12(GND)
VBUSB: C7.2 D1.2(A) U2.3(VDD5) U2.9(VBUS) USB1.A4B9(VBUS) USB1.B4A9(VBUS)
VCC: R8.2 R9.2
VIN: SW1.2(PIN2) USB3.A9(VBUS) USB3.B9(VBUS)
A0_RAIN: H16.1 U6.19
BEEP: H8.2 U7.7
CHIP_UP: C3.2 C5.2 H1.3 Q1.3(C) R1.1 RST.2 U1.3(EN)
D+: U2.7(UD+) USB1.A6(Dp1) USB1.B6(Dp2)
D-: U2.8(UD-) USB1.A7(Dn1) USB1.B7(Dn2)
DO_RAIN: H16.2 U6.18
DTR: Q2.2(E) R6.2 U2.12(DTRTNOW)
FAN_CTL: H11.3 U7.9
GPIO0: BOOT.2 C4.2 H2.14 Q2.3(C) U1.27(IO0)
GPIO1: H2.4 U1.39(IO1)
GPIO2: H2.5 U1.38(IO2)
GPIO3: H1.13 R5.1 U1.15(IO3)
GPIO4: H1.4 U1.4(IO4)
GPIO5: H1.5 U1.5(IO5)
GPIO6: H1.6 U1.6(IO6)
GPIO7: H1.7 U1.7(IO7)
GPIO8: H1.12 U1.12(IO8)
GPIO9: H1.15 U1.17(IO9)
GPIO10: H1.16 U1.18(IO10)
GPIO11: H1.17 U1.19(IO11)
GPIO12: H1.18 U1.20(IO12)
GPIO13: H1.19 U1.21(IO13)
GPIO14: H1.20 U1.22(IO14)
GPIO15: H1.8 U1.8(IO15)
GPIO16: H1.9 U1.9(IO16)
GPIO17: H1.10 U1.10(IO17)
GPIO18: H1.11 U1.11(IO18)
GPIO19: U1.13(IO19) USB2.A7(Dn1) USB2.B7(Dn2)
GPIO20: H2.19 U1.14(IO20) USB2.A6(Dp1) USB2.B6(Dp2)
GPIO21: H2.18 U1.23(IO21)
GPIO35: H2.13 U1.28(IO35)
GPIO36: H2.12 U1.29(IO36)
GPIO37: H2.11 U1.30(IO37)
GPIO38: H2.10 U1.31(IO38)
GPIO39: H2.9 U1.32(IO39)
GPIO40: H2.8 U1.33(IO40)
GPIO41: H2.7 U1.34(IO41)
GPIO42: H2.6 U1.35(IO42)
GPIO45: H2.15 U1.26(IO45)
GPIO46: H1.14 U1.16(IO46)
GPIO47: H2.17 U1.24(IO47)
GPIO48: H2.16 R25.2 U1.25(IO48)
PWM_1: H7.1 U7.4
RED_DATA: H10.2 U7.6
RGB_CTRL: LED3.4(DIN) R25.1
RS485_A: R21.1 R37.2 U8.6(A) U9.2
RS485_B: R21.2 R36.1 U8.7(B) U9.1
RTS: Q1.2(E) R7.2 U2.13(RTS)
RX0: R35.1 U6.13 U8.1(RO)
SCK: H6.2 U6.17
SDA: H6.1 U6.16
TEMP_DATA: H9.2 U7.5
TX0: R33.1 U6.12
U0RXD: H2.3 LED2.1(K) U1.36(RXD0) U2.4(TXD)
U0TXD: H2.2 LED1.1(K) U1.37(TXD0) U2.5(RXD)
WET: R23.1 U7.8
$1N9036: LED5.2(A) R26.1
$1N9283: D4.2(A) L2.1 U5.1(SW)
$1N9292: R12.1 R13.2 U5.3(FB)
$1N10351: H6.3 R27.2 SW3.2(PIN2)
$1N10356: LED6.2(A) R27.1
$1N10410: LED7.2(A) R28.1
$1N10425: H7.2 R28.2 SW4.2(PIN2)
$1N10481: H8.1 R29.2 SW5.2(PIN2)
$1N10486: LED8.2(A) R29.1
$1N10515: LED9.2(A) R30.1
$1N10525: H9.1 R30.2 SW6.2(PIN2)
$1N10556: LED10.2(A) R31.1
$1N10570: H10.1 R31.2 SW7.2(PIN2)
$1N10629: H11.1 R32.2 SW8.2(PIN2)
$1N10642: LED11.2(A) R32.1
$1N10692: Q3.1(B) R33.2
$1N10709: Q3.3(C) R34.1 U8.2(RE#) U8.3(DE)
$1N10944: C15.1 U8.8(VCC)
$1N11282: Q4.1(G) R23.2 R24.2
$1N11321: H5.1 L3.3
$1N11329: H5.2 L3.1 Q4.3(D)
$1N18758: H16.4 R38.1 SW9.2(PIN2)
$1N18759: LED12.2(A) R38.2
Net-(C8-2): C8.2 U2.6(V3)
Net-(D2-2): D2.2(A) R10.2 USB2.A4B9(VBUS) USB2.B4A9(VBUS)
Net-(D3-2): D3.2(A) H1.21
Net-(LED1-2): LED1.2(A) R8.1
Net-(LED2-2): LED2.2(A) R9.1
Net-(LED4-2): LED4.2(A) R11.2
Net-(Q1-1): Q1.1(B) R6.1
Net-(Q2-1): Q2.1(B) R7.1
Net-(R2-1): R2.1 USB1.B5(CC2)
Net-(R3-1): R3.1 USB1.A5(CC1)
Net-(R4-1): R4.1 R5.2
Net-(R14-1): R14.1 USB2.B5(CC2)
Net-(R15-1): R15.1 USB2.A5(CC1)

Not connected (* = marked no-connect by the designer): H2 20; LED3 2(DOUT)*; U2 10(ACT#)* 11(DCD)* 14(DSR)* 15(CTS)* 16(RI)*; U5 6(NC)*; U6 3 4 5 6 7 8 9 10 11 14 15 20 21; U7 2 3 10 11 12 13 14 15 16 17 18 19 20; USB1 13(EH) 14(EH) A8(SBU1)* B8(SBU2)*; USB2 13(EH) 14(EH) A8(SBU1)* B8(SBU2)*; USB3 7(EH) A5(CC1)* B5(CC2)*

## Notes on the sheet
- ESP32最小系统
- 485接口
- 喷雾模块
- OLED/舵机/蜂鸣器/DHT11/红外/风扇/雨水
- 电源系统
